# Altium schematic sheet Battery Monitor.SchDoc
size A; SheetNumber: 4; SheetTotal: 4
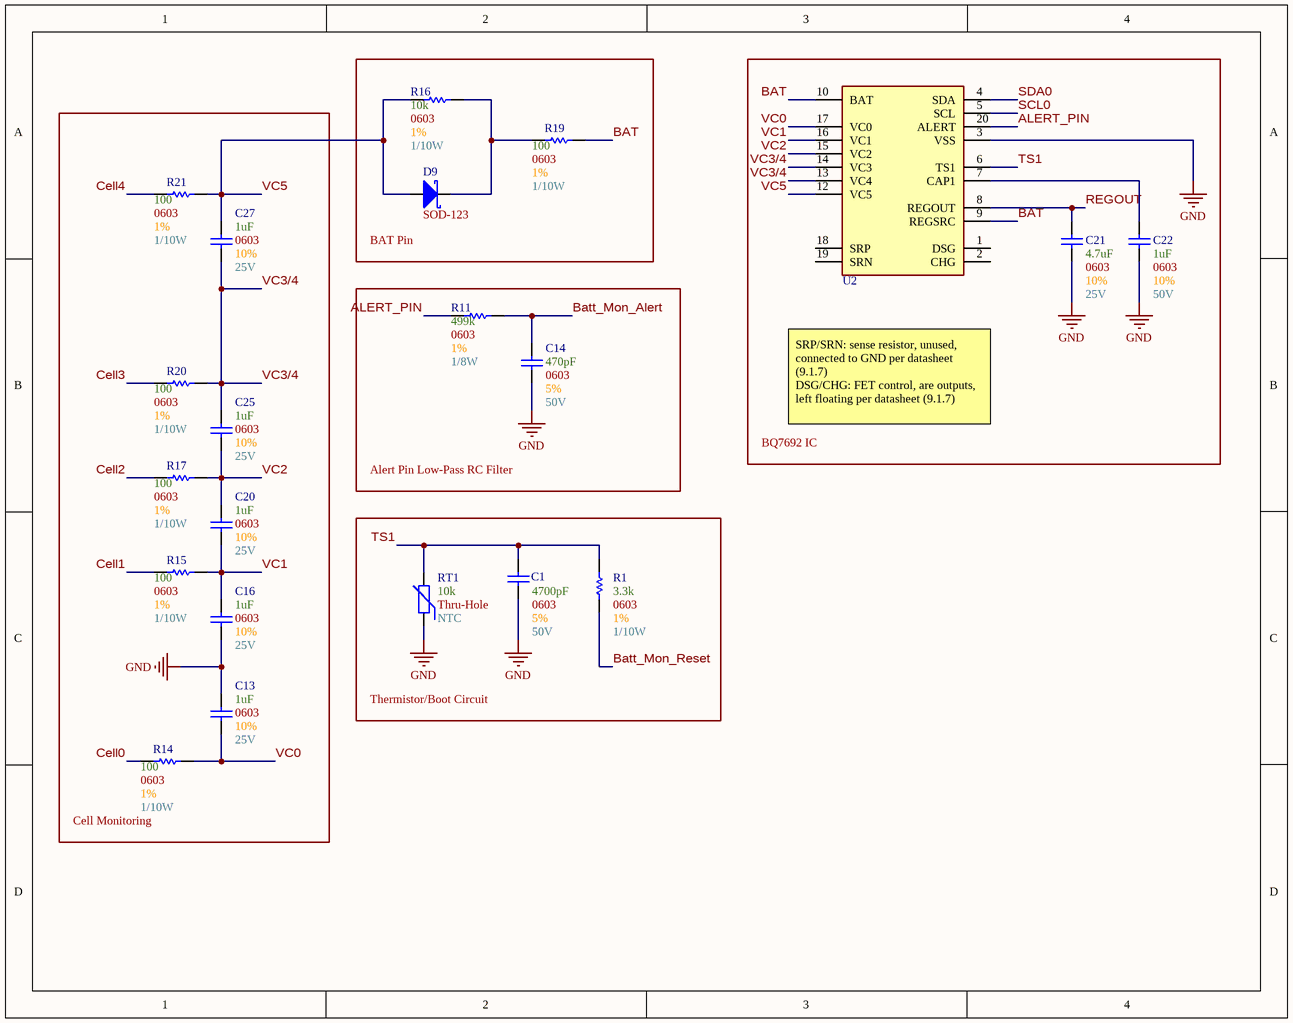
[diagram p0: Battery Monitor.SchDoc]

## Parts
C1  Max Voltage: 50V  Size Package: 0603  Tolerance: 5%  Capacitance: 4700pF  [[Cap] SMD 0603]  (hidden comment: [Cap] 0603 4700pF 5% 50V)
C13  Max Voltage: 25V  Size Package: 0603  Tolerance: 10%  Capacitance: 1uF  [[Cap] SMD 0603]  (hidden comment: [Cap] 0603 1uF 10% 25V)
C14  Max Voltage: 50V  Size Package: 0603  Tolerance: 5%  Capacitance: 470pF  [[Cap] SMD 0603]  (hidden comment: [Cap] 0603 470pF 5% 50V)
C16  Max Voltage: 25V  Size Package: 0603  Tolerance: 10%  Capacitance: 1uF  [[Cap] SMD 0603]  (hidden comment: [Cap] 0603 1uF 10% 25V)
C20  Max Voltage: 25V  Size Package: 0603  Tolerance: 10%  Capacitance: 1uF  [[Cap] SMD 0603]  (hidden comment: [Cap] 0603 1uF 10% 25V)
C21  Max Voltage: 25V  Size Package: 0603  Tolerance: 10%  Capacitance: 4.7uF  [[Cap] SMD 0603]  (hidden comment: [Cap] 0603 4.7uF 10% 25V)
C22  Max Voltage: 50V  Size Package: 0603  Tolerance: 10%  Capacitance: 1uF  [[Cap] SMD 0603]  (hidden comment: [Cap] 0603 1uF 10% 50V)
C25  Max Voltage: 25V  Size Package: 0603  Tolerance: 10%  Capacitance: 1uF  [[Cap] SMD 0603]  (hidden comment: [Cap] 0603 1uF 10% 25V)
C27  Max Voltage: 25V  Size Package: 0603  Tolerance: 10%  Capacitance: 1uF  [[Cap] SMD 0603]  (hidden comment: [Cap] 0603 1uF 10% 25V)
D9  Footprint: SOD-123  [[Diode] SMD SOD-123]  (hidden comment: SOD123)
R1  Wattage: 1/10W  Tolerance: 1%  Resistance: 3.3k  Size Package: 0603  [[Res] SMD 0603]  (hidden comment: [3.3k] SMD 0603 1% 1/10W)
R11  Wattage: 1/8W  Tolerance: 1%  Resistance: 499k  Size Package: 0603  [[Res] SMD 0603]  (hidden comment: [499k] SMD 0603 1% 1/8W)
R14  Wattage: 1/10W  Tolerance: 1%  Resistance: 100  Size Package: 0603  [[Res] SMD 0603]  (hidden comment: [100] SMD 0603 1% 1/10W)
R15  Wattage: 1/10W  Tolerance: 1%  Resistance: 100  Size Package: 0603  [[Res] SMD 0603]  (hidden comment: [100] SMD 0603 1% 1/10W)
R16  Wattage: 1/10W  Tolerance: 1%  Resistance: 10k  Size Package: 0603  [[Res] SMD 0603]  (hidden comment: [10k] SMD 0603 1% 1/8W)
R17  Wattage: 1/10W  Tolerance: 1%  Resistance: 100  Size Package: 0603  [[Res] SMD 0603]  (hidden comment: [100] SMD 0603 1% 1/10W)
R19  Wattage: 1/10W  Tolerance: 1%  Resistance: 100  Size Package: 0603  [[Res] SMD 0603]  (hidden comment: [100] SMD 0603 1% 1/10W)
R20  Wattage: 1/10W  Tolerance: 1%  Resistance: 100  Size Package: 0603  [[Res] SMD 0603]  (hidden comment: [100] SMD 0603 1% 1/10W)
R21  Wattage: 1/10W  Tolerance: 1%  Resistance: 100  Size Package: 0603  [[Res] SMD 0603]  (hidden comment: [100] SMD 0603 1% 1/10W)
RT1  Mounting Style: Thru-Hole  Technology: NTC  Res at 25degC: 10k  [[NTC] 10k Thru-Hole 5mm Pitch]  (hidden comment: [NTC] 10k Thru-Hole 5mm Pitch)
U2  [Batt Mon] 3-5 Cell BMS  [[Batt Mon] 3-5 Cell BMS]  (value not drawn)

## Blocks framed on the sheet
BAT Pin: D9 R16 R19
BQ7692 IC: C21 C22 U2
Cell Monitoring: C13 C16 C20 C25 C27 R14 R15 R17 R20 R21
Alert Pin Low-Pass RC Filter: C14 R11
Thermistor/Boot Circuit: C1 R1 RT1

## Nets
GND: C1.1 C13.2 C14.1 C16.1 C21.1 C22.1 RT1.1 U2.3(VSS)
ALERT_PIN: R11.1 U2.20(ALERT)
BAT: R19.2 U2.9(REGSRC) U2.10(BAT)
Batt_Mon_Alert: C14.2 R11.2
Batt_Mon_Reset: R1.1
Cell0: R14.1
Cell1: R15.1
Cell2: R17.1
Cell3: R20.1
Cell4: R21.1
REGOUT: C21.2 U2.8(REGOUT)
SCL0: U2.5(SCL)
SDA0: U2.4(SDA)
TS1: C1.2 R1.2 RT1.2 U2.6(TS1)
VC0: C13.1 R14.2 U2.17(VC0)
VC1: C16.2 C20.1 R15.2 U2.16(VC1)
VC2: C20.2 C25.1 R17.2 U2.15(VC2)
VC3/4: C25.2 C27.1 R20.2 U2.13(VC4) U2.14(VC3)
VC5: C27.2 D9.2(A) R16.2 R21.2 U2.12(VC5)
NetC22_2: C22.2 U2.7(CAP1)
NetD9_1: D9.1(K) R16.1 R19.1

Not connected (* = marked no-connect by the designer): U2 1(DSG) 2(CHG) 18(SRP) 19(SRN)

## Notes on the sheet
- SRP/SRN: sense resistor, unused, connected to GND per datasheet (9.1.7)
  DSG/CHG: FET control, are outputs, left floating per datasheet (9.1.7)

## Library data of the parts
C1 = [Cap] 0603 4700pF 5% 50V: GRM1885C1H472JA01D; Supplier 1: DigiKey; Supplier Part Number 1: 490-9669-6-ND
C13 C16 C20 C25 C27 = [Cap] 0603 1uF 10% 25V: CL10B105KA8NNNC; Supplier 1: DigiKey; Supplier Part Number 1: 1276-1184-1-ND
C14 = [Cap] 0603 470pF 5% 50V: C0603C471J5GACTU; Supplier 1: DigiKey; Supplier Part Number 1: 399-C0603C471J5GACTUDKR-ND
C21 = [Cap] 0603 4.7uF 10% 25V: GRM188R61E475KE11D; Supplier 1: DigiKey; Supplier Part Number 1: 490-7203-6-ND
C22 = [Cap] 0603 1uF 10% 50V: UMK107AB7105KA-T; Supplier 1: DigiKey; Supplier Part Number 1: 587-3247-1-ND
D9 = [Schottky] SMD 40V 1A: B5819W-TP; Supplier 1: DigiKey; Supplier Part Number 1: B5819W-TPMSCT-ND
R1 = [3.3k] SMD 0603 1% 1/10W: RC0603FR-073K3L; Supplier 1: DigiKey; Supplier Part Number 1: 311-3.30KHRCT-ND
R11 = [499k] SMD 0603 1% 1/8W: CRCW0603499KFKEA; Supplier 1: DigiKey; Supplier Part Number 1: 541-499KHCT-ND
R14 R15 R17 R19-R21 = [100] SMD 0603 1% 1/10W: RC0603FR-07100RL; Supplier 1: DigiKey; Supplier Part Number 1: 311-100HRDKR-ND
R16 = [10k] SMD 0603 1% 1/8W: RMCF0603FT10K0; Supplier 1: DigiKey; Supplier Part Number 1: RMCF0603FT10K0DKR-ND
RT1 = [NTC] 10k Thru-Hole 5mm Pitch: B57164K0103J000; Supplier 1: DigiKey; Supplier Part Number 1: 495-2080-ND
U2 = [Batt Mon] 3-5 Cell BMS: BQ7692006PWR; Supplier 1: DigiKey; Supplier Part Number 1: 296-39960-1-ND